# Altium schematic sheet DC116A_MSP430.SchDoc: Controller
size 431 x 279 mm; Date: Not shown in title block; ApprovedBy: Not shown in title block; CheckedBy: Not shown in title block; Author: Not shown in title block; CompanyName: Not shown in title block; DrawnBy: Midhun Raveendran; Engineer: Midhun Raveendran; Organization: Not shown in title block; Address1: Not shown in title block; Address2: Not shown in title block; Address3: Not shown in title block; Address4: Not shown in title block; DocumentNumber: 5; Revision: Use project parameter SCH_Rev; SheetNumber: 5; SheetTotal: 8; PageSetup: Record=PageOptions|CenterHorizontal=True|CenterVertical=True|PrintScale=1.00|XCorrection=1.00|YCorrection=1.00|PrintKind=0|BorderSize=5000000|LeftOffset=0|BottomOffset=0|Orientation=2|PaperLength=1000|PaperWidth=1000|Scale=100|PaperSource=15|PrintQuality=600|MediaType=1|DitherType=10|PaperKind=Letter|PrintScaleMode=1; CurrentTime: Not shown in title block; CurrentDate: Not shown in title block; Time: Not shown in title block; DocumentFullPathAndName: Not shown in title block; DocumentName: Not shown in title block; ModifiedDate: Not shown in title block; ImagePath: Not shown in title block; ProjectName: DC057A
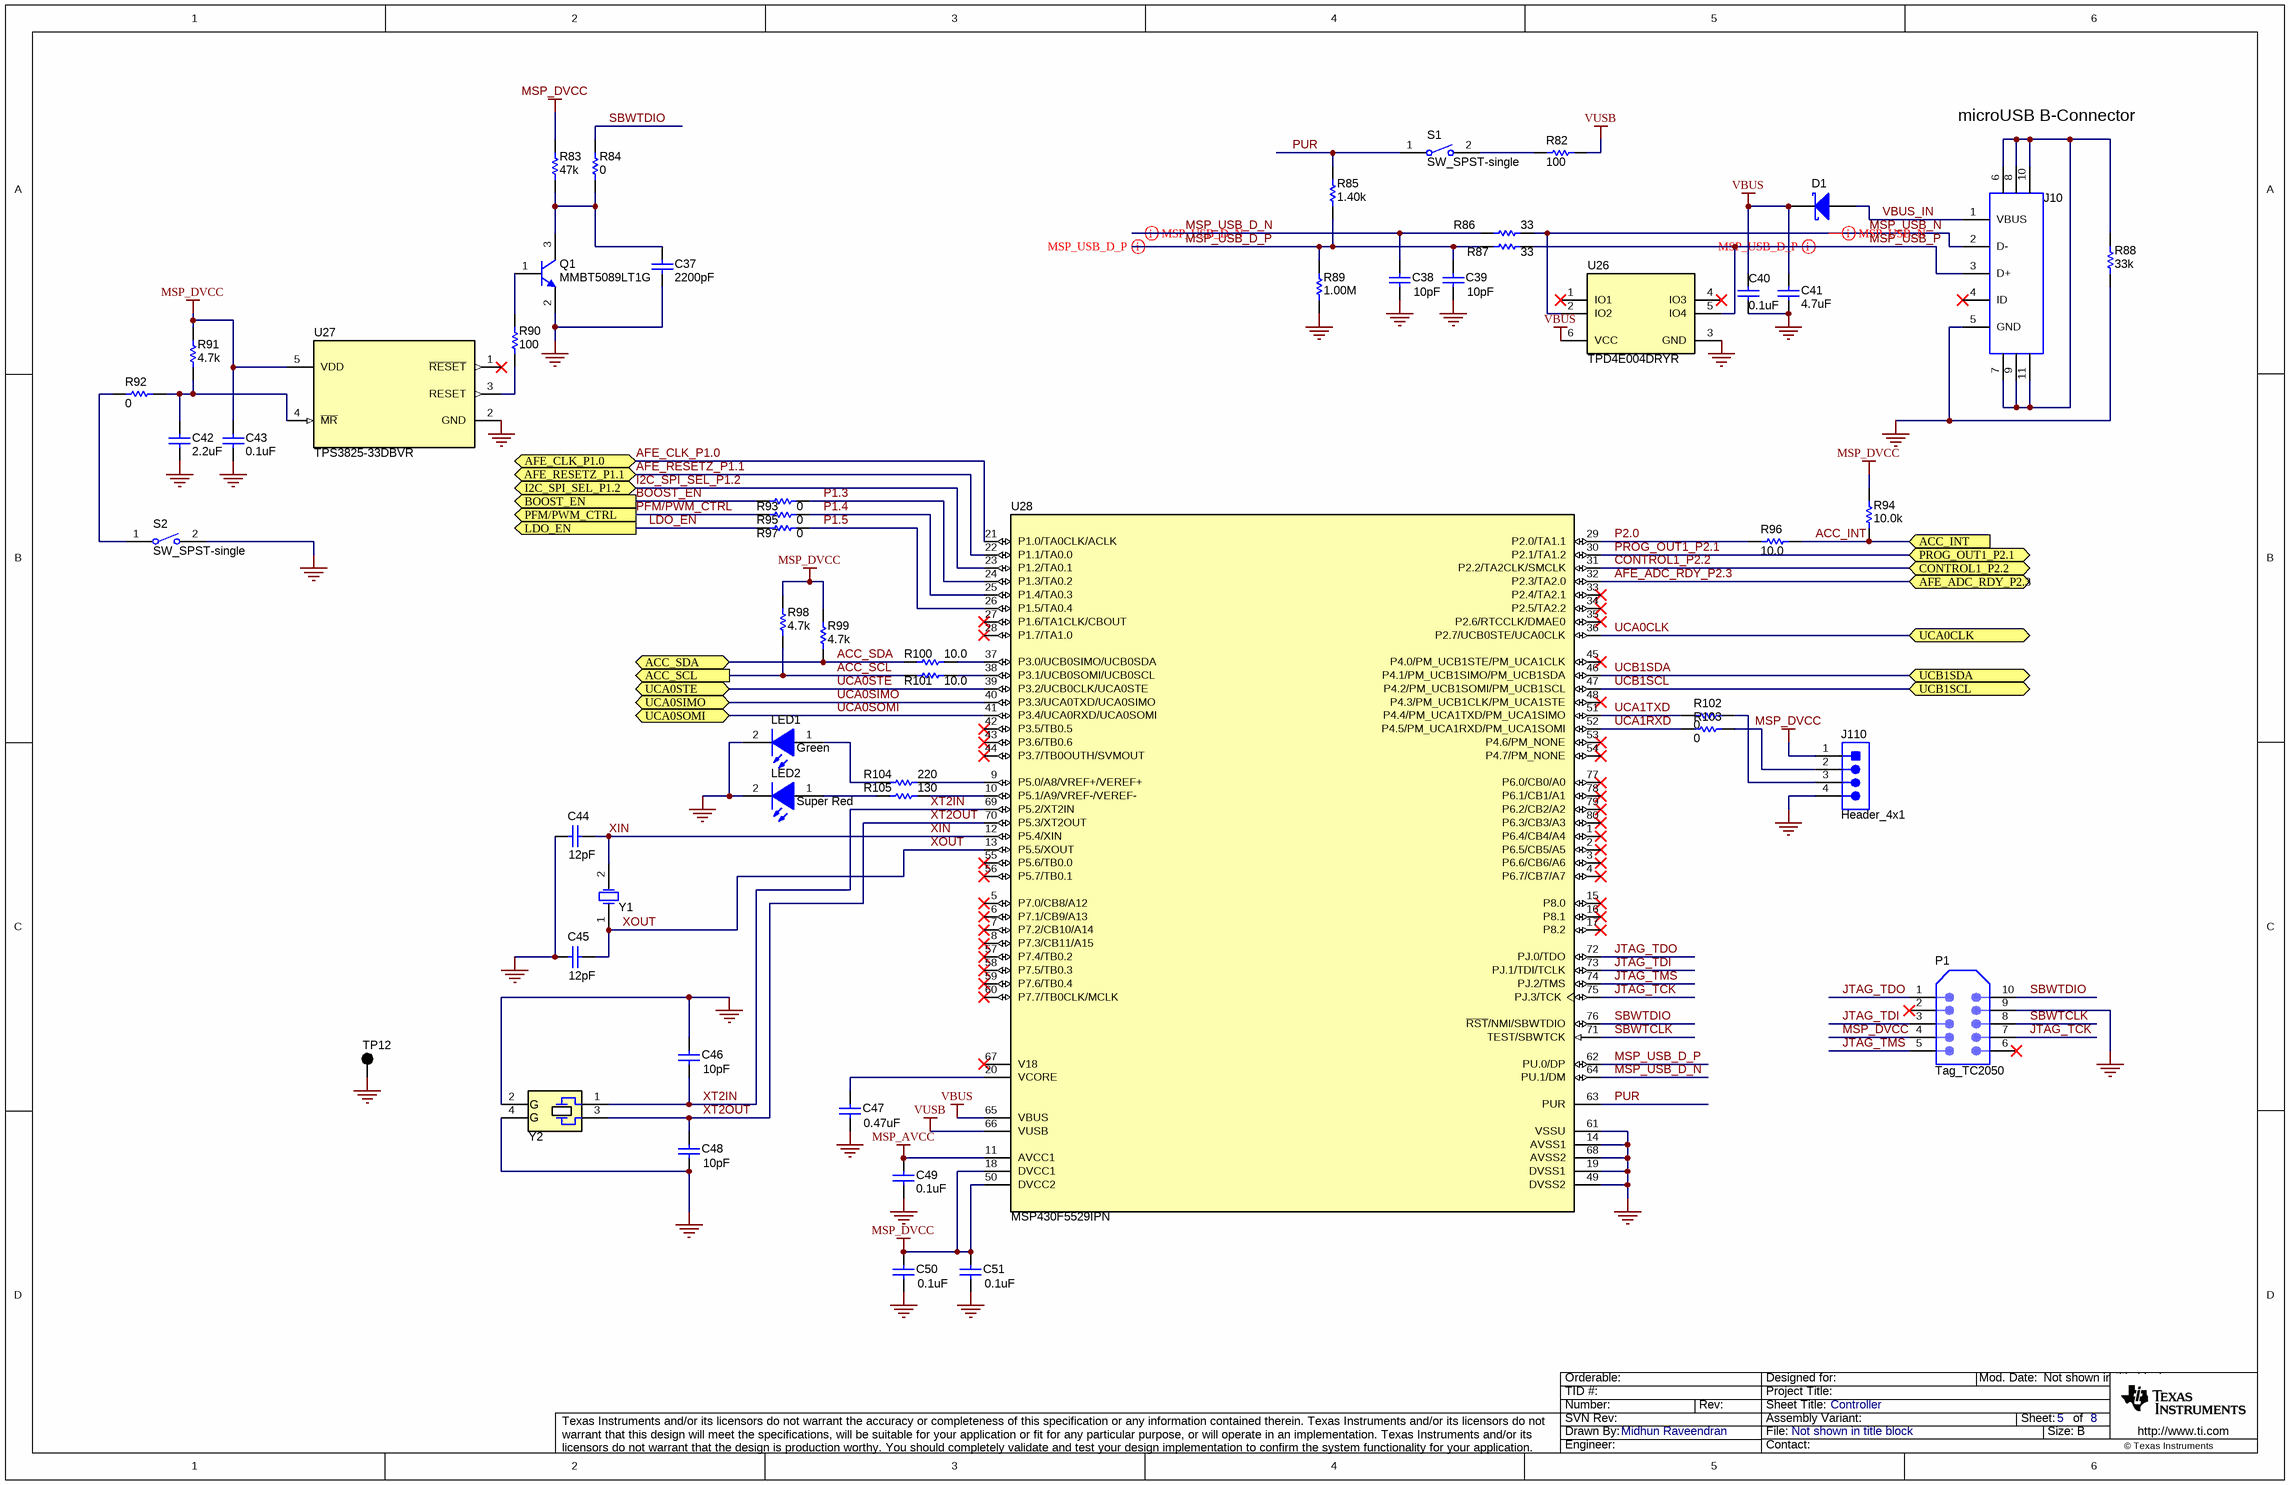
[diagram p0: DC116A_MSP430.SchDoc]

## Parts
C37  ValueDisplayed: 2200pF  [0402]  (hidden comment: Capacitor)
C38  ValueDisplayed: 10pF  [0402]  (hidden comment: 500R07S100JV4T)
C39  ValueDisplayed: 10pF  [0402]  (hidden comment: 500R07S100JV4T)
C40  ValueDisplayed: 0.1uF  [0402]  (hidden comment: 0402YC104KAT2A)
C41  ValueDisplayed: 4.7uF  [0402_065]  (hidden comment: Capacitor)
C42  ValueDisplayed: 2.2uF  [0603]  (hidden comment: Capacitor)
C43  ValueDisplayed: 0.1uF  [0402]  (hidden comment: 0402YC104KAT2A)
C44  ValueDisplayed: 12pF  [0402]  (hidden comment: CL05C120JB5NNNC)
C45  ValueDisplayed: 12pF  [0402]  (hidden comment: CL05C120JB5NNNC)
C46  ValueDisplayed: 10pF  [0402]  (hidden comment: 500R07S100JV4T)
C47  ValueDisplayed: 0.47uF  [0402]  (hidden comment: 04026D474KAT2A)
C48  ValueDisplayed: 10pF  [0402]  (hidden comment: 500R07S100JV4T)
C49  ValueDisplayed: 0.1uF  [0402]  (hidden comment: 0402YC104KAT2A)
C50  ValueDisplayed: 0.1uF  [0402]  (hidden comment: 0402YC104KAT2A)
C51  ValueDisplayed: 0.1uF  [0402]  (hidden comment: 0402YC104KAT2A)
D1  DIODE_SCHOTTKY  [SOD-123]  (value not drawn)
J10  CONN_USB_5Pos-6Shld  [FCI_10118193-0001LF]  (value not drawn)
J110  Header_4x1  [TSW-104-07-G-S]
LED1  value Green  [LED_SML-LX0603GW]  (hidden comment: LED)
LED2  value Super Red  [SML-LX0603SRW_SuperRed]  (hidden comment: LED)
P1  Tag_TC2050  [Tag_TC2050]  (no BOM)
Q1  MMBT5089LT1G  [SOT-23]
R82  ValueDisplayed: 100  [0402]  (hidden comment: Resistor)
R83  ValueDisplayed: 47k  [0402]  (hidden comment: Resistor)
R84  ValueDisplayed: 0  [0402]  (hidden comment: Resistor)
R85  ValueDisplayed: 1.40k  [0402]  (hidden comment: Resistor)
R86  ValueDisplayed: 33  [0402]  (hidden comment: Resistor)
R87  ValueDisplayed: 33  [0402]  (hidden comment: Resistor)
R88  ValueDisplayed: 33k  [0402]  (hidden comment: Resistor)
R89  ValueDisplayed: 1.00M  [0402]  (hidden comment: Resistor)
R90  ValueDisplayed: 100  [0402]  (hidden comment: Resistor)
R91  ValueDisplayed: 4.7k  [0402]  (hidden comment: Resistor)
R92  ValueDisplayed: 0  [0402]  (hidden comment: Resistor)
R93  ValueDisplayed: 0  [0402]  (hidden comment: Resistor)
R94  ValueDisplayed: 10.0k  [0402]  (hidden comment: Resistor)
R95  ValueDisplayed: 0  [0402]  (hidden comment: Resistor)
R96  ValueDisplayed: 10.0  [0402]  (hidden comment: Resistor)
R97  ValueDisplayed: 0  [0402]  (hidden comment: Resistor)
R98  ValueDisplayed: 4.7k  [0402]  (hidden comment: Resistor)
R99  ValueDisplayed: 4.7k  [0402]  (hidden comment: Resistor)
R100  ValueDisplayed: 10.0  [0402]  (hidden comment: Resistor)
R101  ValueDisplayed: 10.0  [0402]  (hidden comment: Resistor)
R102  ValueDisplayed: 0  [0402]  (hidden comment: Resistor)
R103  ValueDisplayed: 0  [0402]  (hidden comment: Resistor)
R104  ValueDisplayed: 220  [0402]  (hidden comment: Resistor)
R105  ValueDisplayed: 130  [0402]  (hidden comment: Resistor)
S1  SW_SPST-single  [SW_RS-032G05A3-SM]
S2  SW_SPST-single  [SW_RS-032G05A3-SM]
TP12  5001  [Keystone5001]  (value not drawn)
U26  PartNumber: TPD4E004DRYR  [DRY0006A]  (hidden comment: TI-TPD4E004-SON_DRY-6)
U27  PartNumber: TPS3825-33DBVR  [DBV0005A_N]  (hidden comment: TPS3825)
U28  PartNumber: MSP430F5529IPN  [PN0080A_N]  (hidden comment: TI-MSP430F552X_A-PN80)
Y1  Xtal  [XTAL_ABS07]  (value not drawn)
Y2  XTAL_4P_13_G24  [ABRACON_ABM3B]  (value not drawn)

## Ports
ACC_INT (in), ACC_SCL (out), ACC_SDA (bidir), AFE_ADC_RDY_P2.3 (bidir), AFE_CLK_P1.0 (bidir), AFE_RESETZ_P1.1 (bidir), BOOST_EN (out), CONTROL1_P2.2 (bidir), I2C_SPI_SEL_P1.2 (bidir), LDO_EN (out), PFM/PWM_CTRL (out), PROG_OUT1_P2.1 (bidir), UCA0CLK (bidir), UCA0SIMO (bidir), UCA0SOMI (bidir), UCA0STE (bidir), UCB1SCL (bidir), UCB1SDA (bidir)

## Nets
GND: C37.2 C38.2 C39.2 C40.1 C41.2 C42.2 C43.1 C44.2 C45.2 C46.1 C47.2 C48.2 C49.1 C50.1 C51.1 J10.5(GND) J110.4 LED1.2(K) LED2.2(K) P1.9 Q1.2(E) R88.1 R89.2 S2.2 TP12.1 U26.3(GND) U27.2(GND) U28.14(AVSS1) U28.19(DVSS1) U28.49(DVSS2) U28.61(VSSU) U28.68(AVSS2) Y2.2(GND) Y2.4(GND)
MSP_AVCC: C49.2 U28.11(AVCC1)
MSP_DVCC: C43.2 C50.2 C51.2 J110.1 P1.4 R83.2 R91.2 R94.2 R98.2 R99.2 U27.5(VDD) U28.18(DVCC1) U28.50(DVCC2)
VBUS: C40.2 C41.1 D1.1(K) U26.6(VCC) U28.65(VBUS)
VUSB: R82.1 U28.66(VUSB)
ACC_INT: R94.1 R96.1 ; port ACC_INT
ACC_SCL: R98.1 R101.2 ; port ACC_SCL
ACC_SDA: R99.1 R100.2 ; port ACC_SDA
AFE_ADC_RDY_P2.3: U28.32(P2.3/TA2.0) ; port AFE_ADC_RDY_P2.3
AFE_CLK_P1.0: U28.21(P1.0/TA0CLK/ACLK) ; port AFE_CLK_P1.0
AFE_RESETZ_P1.1: U28.22(P1.1/TA0.0) ; port AFE_RESETZ_P1.1
BOOST_EN: R93.1 ; port BOOST_EN
CONTROL1_P2.2: U28.31(P2.2/TA2CLK/SMCLK) ; port CONTROL1_P2.2
I2C_SPI_SEL_P1.2: U28.23(P1.2/TA0.1) ; port I2C_SPI_SEL_P1.2
JTAG_TCK: P1.7 U28.75(PJ.3/TCK)
JTAG_TDI: P1.3 U28.73(PJ.1/TDI/TCLK)
JTAG_TDO: P1.1 U28.72(PJ.0/TDO)
JTAG_TMS: P1.5 U28.74(PJ.2/TMS)
LDO_EN: R97.1 ; port LDO_EN
MSP_USB_D_N: C38.1 R86.1 U28.64(PU.1/DM)
MSP_USB_D_P: C39.1 R85.1 R87.1 R89.1 U28.62(PU.0/DP)
MSP_USB_N: J10.2(D-) R86.2 U26.2(IO2)
MSP_USB_P: J10.3(D+) R87.2 U26.5(IO4)
P1.3: R93.2 U28.24(P1.3/TA0.2)
P1.4: R95.2 U28.25(P1.4/TA0.3)
P1.5: R97.2 U28.26(P1.5/TA0.4)
P2.0: R96.2 U28.29(P2.0/TA1.1)
PFM/PWM_CTRL: R95.1 ; port PFM/PWM_CTRL
PROG_OUT1_P2.1: U28.30(P2.1/TA1.2) ; port PROG_OUT1_P2.1
PUR: R85.2 S1.1 U28.63(PUR)
SBWTCLK: P1.8 U28.71(TEST/SBWTCK)
SBWTDIO: P1.10 R84.2 U28.76(~{RST}/NMI/SBWTDIO)
UCA0CLK: U28.36(P2.7/UCB0STE/UCA0CLK) ; port UCA0CLK
UCA0SIMO: U28.40(P3.3/UCA0TXD/UCA0SIMO) ; port UCA0SIMO
UCA0SOMI: U28.41(P3.4/UCA0RXD/UCA0SOMI) ; port UCA0SOMI
UCA0STE: U28.39(P3.2/UCB0CLK/UCA0STE) ; port UCA0STE
UCA1RXD: R103.1 U28.52(P4.5/PM_UCA1RXD/PM_UCA1SOMI)
UCA1TXD: R102.1 U28.51(P4.4/PM_UCA1TXD/PM_UCA1SIMO)
UCB1SCL: U28.47(P4.2/PM_UCB1SOMI/PM_UCB1SCL) ; port UCB1SCL
UCB1SDA: U28.46(P4.1/PM_UCB1SIMO/PM_UCB1SDA) ; port UCB1SDA
VBUS_IN: D1.2(A) J10.1(VBUS)
XIN: C44.1 U28.12(P5.4/XIN) Y1.2(OSC2)
XOUT: C45.1 U28.13(P5.5/XOUT) Y1.1(OSC1)
XT2IN: C46.2 U28.69(P5.2/XT2IN) Y2.1
XT2OUT: C48.1 U28.70(P5.3/XT2OUT) Y2.3
NetC37_1: C37.1 Q1.3(C) R83.1 R84.1
NetC42_1: C42.1 R91.1 R92.2 U27.4(~{MR})
NetC47_1: C47.1 U28.20(VCORE)
NetJ10_6: J10.6 J10.7 J10.8 J10.9 J10.10 J10.11 R88.2
NetJ110_2: J110.2 R103.2
NetJ110_3: J110.3 R102.2
NetLED1_1: LED1.1(A) R104.1
NetLED2_1: LED2.1(A) R105.1
NetQ1_1: Q1.1(B) R90.2
NetR82_2: R82.2 S1.2
NetR90_1: R90.1 U27.3(RESET)
NetR92_1: R92.1 S2.1
NetR100_1: R100.1 U28.37(P3.0/UCB0SIMO/UCB0SDA)
NetR101_1: R101.1 U28.38(P3.1/UCB0SOMI/UCB0SCL)
NetR104_2: R104.2 U28.9(P5.0/A8/VREF+/VEREF+)
NetR105_2: R105.2 U28.10(P5.1/A9/VREF-/VEREF-)

Not connected (* = marked no-connect by the designer): J10 4(ID)*; P1 2* 6*; U26 1(IO1)* 4(IO3)*; U27 1(~{RESET})*; U28 1(P6.4/CB4/A4)* 2(P6.5/CB5/A5)* 3(P6.6/CB6/A6)* 4(P6.7/CB7/A7)* 5(P7.0/CB8/A12)* 6(P7.1/CB9/A13)* 7(P7.2/CB10/A14)* 8(P7.3/CB11/A15)* 15(P8.0)* 16(P8.1)* 17(P8.2)* 27(P1.6/TA1CLK/CBOUT)* 28(P1.7/TA1.0)* 33(P2.4/TA2.1)* 34(P2.5/TA2.2)* 35(P2.6/RTCCLK/DMAE0)* 42(P3.5/TB0.5)* 43(P3.6/TB0.6)* 44(P3.7/TB0OUTH/SVMOUT)* 45(P4.0/PM_UCB1STE/PM_UCA1CLK)* 48(P4.3/PM_UCB1CLK/PM_UCA1STE)* 53(P4.6/PM_NONE)* 54(P4.7/PM_NONE)* 55(P5.6/TB0.0)* 56(P5.7/TB0.1)* 57(P7.4/TB0.2)* 58(P7.5/TB0.3)* 59(P7.6/TB0.4)* 60(P7.7/TB0CLK/MCLK)* 67(V18)* 77(P6.0/CB0/A0)* 78(P6.1/CB1/A1)* 79(P6.2/CB2/A2)* 80(P6.3/CB3/A3)*

## Layout directives
differential pair: MSP_USB_D_N, MSP_USB_D_P, MSP_USB_N, MSP_USB_P

## Notes on the sheet
- microUSB B-Connector
- Drawn By:
- SVN Rev:
- Number:
- TID #:
- Orderable:
- Rev:
- Sheet Title:
- File:
- Project Title:
- Designed for:
- Assembly Variant:
- Mod. Date:
- Sheet:
- Size:
- of
- B
- http://www.ti.com
- Texas Instruments and/or its licensors do not warrant the accuracy or completeness of this specification or any information contained therein. Texas Instruments and/or its licensors do not warrant that this design will meet the specifications, will be suitable for your application or fit for any particular purpose, or will operate in an implementation. Texas Instruments and/or its licensors do not warrant that the design is production worthy. You should completely validate and test your design implementation to confirm the system functionality for your application.
- Engineer:
- Contact:
- © Texas Instruments
- (in symbol CMP-0004629-4) G

## Library data of the parts
C37 = CMP-0006683-2: CAP, CERM, 2200 pF, 50 V, +/- 10%, X7R, 0402; PartNumber: GRM155R71H222KA01D; Manufacturer: MuRata; Polarized: N; Value: 2200pF; U/M: EA; Cap_F: 2.2nF; Value1: Unknown; VDC_V: 50V; TaMin_C: -55°C; TaMax_C: 125°C; SizeArea_mm2: 0.5; SizeAreaWB_mm2: 3; SizeX_mm: 1; SizeZ_mm: 0.6; AEC Category: Q200; CompType: Capacitor; PackageReference: 0402; RoHS: Y; Tolerance_%: 10%; Value2: 50V; MountType: SMT; Technology: Ceramic; TempCo: X7R; Cap_Case: 0402; Published: 2008-06-19; Publisher: Texas Instruments; LatestRevisionDate: 2017-03-09; ComponentLink1Description: Datasheet link; ComponentLink1URL: http://search.murata.co.jp/Ceramy/PnsearchViewAction.do?HnOFG=ON&HnNFG=ON&SEL_CNT=50&sLang=en&sKey=GRM155R71H222KA01D&x=9&y=9&search=startwith; Supplier 1: Digi-Key; Supplier Part Number 1: 490-1305-1-ND; Supplier 2: Newark; Supplier Part Number 2: 14T3287; Supplier 3: Mouser; Supplier Part Number 3: 81-GRM36X222K50; SizeY_mm: 0.5; AEC Qualified: ?
C38 C39 C46 C48 = CMP-0006207-2: CAP, CERM, 10 pF, 50 V, +/- 5%, C0G/NP0, 0402; Manufacturer: Johanson Technology; TaMin_C: -55°C; Polarized: N; SizeAreaWB_mm2: 3; Value1: Unknown; U/M: EA; Value: 10pF; TaMax_C: 125°C; SizeZ_mm: 0.6; SizeX_mm: 1; SizeY_mm: 0.5; Value2: 50V; AEC Category: Q200; Publisher: Texas Instruments; TempCo: C0G/NP0; Published: 2008-06-19; RoHS: Y; MountType: SMT; PackageReference: 0402; Tolerance_%: 5%; Cap_Case: 0402; SizeArea_mm2: 0.5; CompType: Capacitor; LatestRevisionDate: 2017-03-09; PartNumber: 500R07S100JV4T; AEC Qualified: ?; Cap_F: 10pF; VDC_V: 50V; ComponentLink1Description: Datasheet link; Technology: Ceramic; ComponentLink1URL: http://www.johansontechnology.com/images/stories/catalog/JTI_CAT_2012_MLCC_HighQ.pdf
C40 C43 C49-C51 = CMP-0006201-2: CAP, CERM, 0.1 uF, 16 V, +/- 10%, X7R, 0402; Manufacturer: AVX; TaMin_C: -55°C; Polarized: N; SizeAreaWB_mm2: 3; Value1: Unknown; U/M: EA; Value: 0.1uF; TaMax_C: 125°C; SizeZ_mm: 0.6; SizeX_mm: 1; SizeY_mm: 0.5; Value2: 16V; Cap_F: 100nF; AEC Category: Q200; Supplier Part Number 2: 09R7024; Publisher: Texas Instruments; Supplier 2: Newark; Supplier Part Number 3: 581-0402YC104KAT2A; TempCo: X7R; Supplier 3: Mouser; Published: 2008-06-19; RoHS: Y; MountType: SMT; Supplier 1: Digi-Key; PackageReference: 0402; Tolerance_%: 10%; Cap_Case: 0402; SizeArea_mm2: 0.5; CompType: Capacitor; LatestRevisionDate: 2017-03-09; PartNumber: 0402YC104KAT2A; AEC Qualified: N; VDC_V: 16V; ComponentLink1Description: Datasheet link; AEC Grade: N/A; Supplier Part Number 1: 478-7888-1-ND; Technology: Ceramic; ComponentLink1URL: http://catalogs.avx.com/SurfaceMount.pdf
C41 = CMP-0006268-2: CAP, CERM, 4.7 uF, 10 V, +/- 10%, X5R, 0402; PartNumber: C1005X5R1A475K050BC; Manufacturer: TDK; Polarized: N; Value: 4.7uF; U/M: EA; Cap_F: 4.7µF; ESR_ohm: 3.417m; Value1: 0.003417 ohm; VDC_V: 10V; IRMS_A: 2.7063A; TaMin_C: -55°C; TaMax_C: 85°C; SizeArea_mm2: 0.5; SizeAreaWB_mm2: 3; SizeX_mm: 1; SizeZ_mm: 0.65; AEC Category: Q200; CompType: Capacitor; PackageReference: 0402; RoHS: Y; Tolerance_%: 10%; Value2: 10V; MountType: SMT; Technology: Ceramic; TempCo: X5R; Cap_Case: 0402_065; Published: 2008-06-19; Publisher: Texas Instruments; LatestRevisionDate: 2017-03-09; ComponentLink1Description: Datasheet link; ComponentLink1URL: https://product.tdk.com/en/search/capacitor/ceramic/mlcc/info?part_no=C1005X5R1A475K050BC; Supplier 1: Digi-Key; Supplier Part Number 1: 445-13820-1-ND; Supplier 2: Newark; Supplier Part Number 2: 29X4772; Supplier 3: Mouser; Supplier Part Number 3: 810-C1005X5R1A475KBC; SizeY_mm: 0.5; AEC Qualified: N; AEC Grade: N/A
C42 = CMP-0006906-5: CAP, CERM, 2.2 uF, 10 V, +/- 10%, X5R, 0603; PartNumber: C0603C225K8PACTU; Manufacturer: Kemet; Polarized: N; Value: 2.2uF; U/M: EA; Cap_F: 2.2µF; Value1: Unknown; VDC_V: 10V; TaMin_C: -55°C; TaMax_C: 85°C; SizeArea_mm2: 1.28; SizeAreaWB_mm2: 4.68; SizeX_mm: 1.6; SizeY_mm: 0.8; SizeZ_mm: 1; AEC Category: Q200; CompType: Capacitor; PackageReference: 0603; RoHS: Y; Tolerance_%: 10%; Value2: 10V; MountType: SMT; Technology: Ceramic; TempCo: X5R; Cap_Case: 0603; Published: 2008-06-19; Publisher: Texas Instruments; LatestRevisionDate: 2017-03-09; ComponentLink1Description: Datasheet link; ComponentLink1URL: http://www.kemet.com/kemet/web/homepage/kechome.nsf/vapubfiles/F3102_Y5V.pdf/$file/F3102_Y5V.pdf; Supplier 1: Digi-Key; Supplier Part Number 1: 399-4911-1-ND; Supplier 2: Mouser; Supplier Part Number 2: 80-C0603C225K8P; Supplier 3: Farnell; Supplier Part Number 3: 1108322; AEC Qualified: ?
C44 C45 = CMP-0006345-2: CAP, CERM, 12 pF, 50 V, +/- 5%, C0G/NP0, 0402; Manufacturer: Samsung Electro-Mechanics; TaMin_C: -55°C; Polarized: N; SizeAreaWB_mm2: 3; Value1: Unknown; U/M: EA; Value: 12pF; TaMax_C: 125°C; SizeZ_mm: 0.6; SizeX_mm: 1; SizeY_mm: 0.5; Value2: 50V; AEC Category: Q200; Publisher: Texas Instruments; TempCo: C0G/NP0; Published: 2008-06-19; RoHS: Y; MountType: SMT; Supplier 1: Digi-Key; PackageReference: 0402; Tolerance_%: 5%; Cap_Case: 0402; SizeArea_mm2: 0.5; CompType: Capacitor; LatestRevisionDate: 2017-03-09; PartNumber: CL05C120JB5NNNC; AEC Qualified: N; Cap_F: 12pF; VDC_V: 50V; ComponentLink1Description: Datasheet link; AEC Grade: N/A; Supplier Part Number 1: 1276-1178-1-ND; Technology: Ceramic; ComponentLink1URL: http://www.samsungsem.com/servlet/FileDownload?type=spec&file=CL05C120JB5NNNC.pdf
C47 = CMP-0006199-2: CAP, CERM, 0.47 uF, 6.3 V, +/- 10%, X5R, 0402; Manufacturer: AVX; TaMin_C: -55°C; Polarized: N; SizeAreaWB_mm2: 3; Value1: Unknown; U/M: EA; Value: 0.47uF; TaMax_C: 85°C; SizeZ_mm: 0.6; SizeX_mm: 1; SizeY_mm: 0.5; Value2: 6.3V; Cap_F: 470nF; AEC Category: Q200; Supplier Part Number 2: 60R6163; Publisher: Texas Instruments; Supplier 2: Newark; Supplier Part Number 3: 581-04026D474KAT2A; TempCo: X5R; Supplier 3: Mouser; Published: 2008-06-19; RoHS: Y; MountType: SMT; Supplier 1: Digi-Key; PackageReference: 0402; Tolerance_%: 10%; Cap_Case: 0402; SizeArea_mm2: 0.5; CompType: Capacitor; LatestRevisionDate: 2017-03-09; PartNumber: 04026D474KAT2A; AEC Qualified: N; VDC_V: 6.3V; ComponentLink1Description: Datasheet link; AEC Grade: N/A; Supplier Part Number 1: 478-6196-1-ND; Technology: Ceramic; ComponentLink1URL: http://catalogs.avx.com/SurfaceMount.pdf
D1 = CMP-0028543-1: Diode, Schottky, 40 V, 0.35 A, SOD-123; PartNumber: SD103AW-7-F; Manufacturer: Diodes Inc.; U/M: EA; Vf_V: 5.5dV; Value: 40V; Value1: 0.35A; Value2: 0.55V; Io_A: 3.5dA; SizeAreaWB_mm2: 13.095; SizeArea_mm2: 6.545; SizeX_mm: 3.85; SizeY_mm: 1.7; SizeZ_mm: 1.35; AEC Category: Q101; Green_Lifecycle: Active; Green_REACh: Passed; CompType: Diode; PackageReference: SOD-123; Vr_V: 40V; MountType: SMT; Type: Schottky; RoHS: Y; Published: 2008-06-26; Publisher: Texas Instruments; LatestRevisionDate: 2017-05-08; ComponentLink1Description: Datasheet link; ComponentLink1URL: http://www.diodes.com/datasheets/ds11013.pdf; Supplier 1: Digi-Key; Supplier Part Number 1: SD103-AWDICT-ND; Supplier 2: Mouser; Supplier Part Number 2: 621-SD103AW-F; Supplier 3: Farnell; Supplier Part Number 3: 1773500; AEC Qualified: ?; Green_EU RoHS-2: Passed; Green_EU RoHS: Passed
J10 = CMP-0065029-1: Connector, Receptacle, USB Micro B, R/A, SMT; PartNumber: 10118193-0001LF; Manufacturer: FCI; Pitch_mm: 0.65; Gender: Female; Row_Count: 1; ContactFinish: Gold; CNHeader: False; CT: True; PackageReference: Connector, Receptacle, USB Micro B, R/A, SMT; CompType: USB; MountType: SMT; ComponentLink1Description: Datasheet URL; ComponentLink1URL: https://sps06.itg.ti.com/sites/KMS/crossdivteams/altium/docs/ComponentDatasheets/10118193-0001LF.pdf; Orientation: R/A; PinCount: 5; Color: Black; Publisher: Texas Instruments; LatestRevisionDate: 2017-06-05; Supplier 1: Digi-Key; Supplier Part Number 1: 609-4616-1-ND; Supplier 2: Newark; Supplier Part Number 2: 67T2259; Supplier 3: Mouser; Supplier Part Number 3: 649-10118193-0001LF
J110 = CMP-0075409-2: Header, 100mil, 4x1, Gold, TH; Manufacturer: Samtec; Pitch_mm: 2.54; Gender: Male; Shrouded: N; Row_Count: 1; Current_A: 6.3A; Voltage_V: 550V; Cert_CSA: Y; Green_Lifecycle: Active; Green_REACh: Passed; PartNumber: TSW-104-07-G-S; PackageReference: 4x1 Header; ClassName: Header; CompType: Header; RoHS: Y; MountType: TH; ComponentLink1Description: Datasheet URL; ComponentLink1URL: http://samtec.com/ftppub/pdf/TSW_TH.PDF; Supplier 1: Digi-Key; Supplier Part Number 1: SAM1029-04-ND; Orientation: Vertical; PinCount: 4; ContactFinish: Gold; Color: Black; Cert_UL: Y; Cert_CULUS: N; Cert_VDE: N; Green_EU RoHS-2: Passed; Green_EU RoHS: Passed
LED1 = CMP-0002834-1: LED, Green, SMD; Manufacturer: Lumex; PartNumber: SML-LX0603GW-TR; Vf_V: 2.2V; Io_A: 20mA; Tjmax_C: 85°C; Value1: W; U/M: EA; CompType: LED; MountType: SMT; RoHS: Y; PackageReference: LED, GREEN, 0603; Type: ?; Value2: 2.2V; Color: green; Published: 2008-07-11; Publisher: Texas Instruments; ComponentLink1URL: http://www.lumex.com/specs/SML-LX0603GW-TR.pdf; ComponentLink1Description: Datasheet link; LatestRevisionDate: 2017-03-09; Supplier 1: Digi-Key; Supplier Part Number 1: 67-1549-1-ND; Supplier 2: Newark; Supplier Part Number 2: 75K1440; Supplier 3: Mouser; Supplier Part Number 3: 696-SML-LX0603GW
LED2 = CMP-0002876-1: LED, Super Red, SMD; Manufacturer: Lumex; PartNumber: SML-LX0603SRW-TR; Vf_V: 1.7V; Io_A: 20mA; Value1: W; U/M: EA; CompType: LED; MountType: SMT; RoHS: Y; PackageReference: LED, 1.6x.6x.8mm; Type: ?; Value2: 1.7V; Color: super red; Published: 2008-07-11; Publisher: Texas Instruments; ComponentLink1URL: http://www.lumex.com/specs/SML-LX0603SRW-TR.pdf; ComponentLink1Description: Datasheet link; LatestRevisionDate: 2017-03-09; Supplier 1: Digi-Key; Supplier Part Number 1: 67-1551-1-ND; Supplier 2: Newark; Supplier Part Number 2: 09J9551; Supplier 3: Mouser; Supplier Part Number 3: 696-SML-LX0603SRW
P1 = CMP-0075050-1: Footprint for Tag-Connect TC2050 cables; PartNumber: TC2050-IDC-FP; CompType: Receptacle; Note: Footprint only, to mate with Tag-Connect TC2050 cables; CNHeader: False; Manufacturer: Tag-Connect; PackageReference: Footprint for TC2050 series of cables; RoHS: Y; MountType: N/A; ComponentLink1Description: Datasheet URL; ComponentLink1URL: http://www.tag-connect.com/Materials/TC2050-IDC%20Datasheet.pdf; Publisher: Texas Instruments; LatestRevisionDate: 2017-07-12; CT: False
Q1 = CMP-0000465-2: Transistor, NPN, 25 V, 0.05 A, SOT-23; Manufacturer: ON Semiconductor; CompType: BJT; PNP: 0; NPN: 1; Vceo_V: 25V; Vcesat1_V: 5dV; Value: 25 V; IcRated_A: 50mA; Value1: 0.05 A; HfeMax: 1200; TaMin_C: -55°C; TaMax_C: 150°C; U/M: EA; SizeAreaWB_mm2: 14; SizeArea_mm2: 7.5; SizeX_mm: 2.5; SizeY_mm: 3; SizeZ_mm: 1.1; AEC Category: Q101; PartNumber: MMBT5089LT1G; PackageReference: SOT-23; RoHS: Y; Value2: 1200; Published: 2008-07-31; LatestRevisionDate: 2017-03-09; Publisher: Texas Instruments; ComponentLink1Description: Datasheet link; ComponentLink1URL: http://www.onsemi.com/pub_link/Collateral/MMBT5088LT1-D.PDF; Supplier 1: Digi-Key; Supplier Part Number 1: MMBT5089LT1GOSCT-ND; Supplier 2: Newark; Supplier Part Number 2: 98H0755; Supplier 3: Mouser; Supplier Part Number 3: 863-MMBT5089LT1G; MountType: SMT; AEC Qualified: ?
R82 R90 = CMP-0025951-3: RES, 100, 1%, 0.063 W, AEC-Q200 Grade 0, 0402; PartNumber: CRCW0402100RFKED; Manufacturer: Vishay-Dale; Value: 100; Value_Code: 100R; Power_W: 63mW; Value2: 0.063W; VDC_V: 50V; TempCo: 100 ppm/C; EIA_Code: E96; SizeArea_mm2: 0.5; SizeX_mm: 1; SizeZ_mm: 0.6; AEC Category: Q200; AEC Qualified: Y; AEC Grade: 0; CompType: Resistor; PackageReference: 0402; RoHS: E; Res_ohm: 100; Tolerance_%: 1%; Value1: 1%; MountType: SMT; Technology: Thick Film; ComponentLink1Description: Datasheet link; ComponentLink1URL: http://www.vishay.com/docs/20035/dcrcwe3.pdf; Supplier 1: Digi-Key; Supplier Part Number 1: 541-100LCT-ND; Supplier 2: Newark; Supplier Part Number 2: 52K6609; Supplier 3: Mouser; Supplier Part Number 3: 71-CRCW0402-100-E3; SizeY_mm: 0.5
R83 = CMP-0026935-3: RES, 47 k, 5%, 0.063 W, AEC-Q200 Grade 0, 0402; PartNumber: CRCW040247K0JNED; Manufacturer: Vishay-Dale; Value: 47k; Value_Code: 47k0; Power_W: 63mW; Value2: 0.063W; VDC_V: 50V; TempCo: 200 ppm/C; EIA_Code: E24; SizeArea_mm2: 0.5; SizeX_mm: 1; SizeZ_mm: 0.6; AEC Category: Q200; AEC Qualified: Y; AEC Grade: 0; CompType: Resistor; PackageReference: 0402; RoHS: E; Res_ohm: 47k; Tolerance_%: 5%; Value1: 5%; MountType: SMT; Technology: Thick Film; ComponentLink1Description: Datasheet link; ComponentLink1URL: http://www.vishay.com/docs/20035/dcrcwe3.pdf; Supplier 1: Digi-Key; Supplier Part Number 1: 541-47KJCT-ND; Supplier 2: Newark; Supplier Part Number 2: 52K7099; Supplier 3: Mouser; Supplier Part Number 3: 71-CRCW0402-J-47K-E3; SizeY_mm: 0.5
R84 R92 R93 R95 R97 R102 R103 = CMP-0026822-3: RES, 0, 5%, 0.063 W, AEC-Q200 Grade 0, 0402; PartNumber: CRCW04020000Z0ED; Manufacturer: Vishay-Dale; Value: 0; Value_Code: 0000; Power_W: 63mW; Value2: 0.063W; VDC_V: 50V; TempCo: 200 ppm/C; EIA_Code: E24; SizeArea_mm2: 0.5; SizeX_mm: 1; SizeZ_mm: 0.6; AEC Category: Q200; AEC Qualified: Y; CompType: Resistor; PackageReference: 0402; RoHS: E; Res_ohm: 0; Tolerance_%: 5%; Value1: 5%; MountType: SMT; Technology: Thick Film; ComponentLink1Description: Datasheet link; ComponentLink1URL: http://www.vishay.com/docs/20035/dcrcwe3.pdf; Supplier 1: Digi-Key; Supplier Part Number 1: 541-0.0JCT-ND; Supplier 2: Newark; Supplier Part Number 2: 52K6543; Supplier 3: Mouser; Supplier Part Number 3: 71-CRCW0402-0-E3; SizeY_mm: 0.5; AEC Grade: 0
R85 = CMP-0026085-3: RES, 1.40 k, 1%, 0.063 W, AEC-Q200 Grade 0, 0402; PartNumber: CRCW04021K40FKED; Manufacturer: Vishay-Dale; Value: 1.40k; Res_ohm: 1.4k; Value_Code: 1k40; Power_W: 63mW; Value2: 0.063W; VDC_V: 50V; TempCo: 100 ppm/C; EIA_Code: E96; SizeArea_mm2: 0.5; SizeX_mm: 1; SizeZ_mm: 0.6; AEC Category: Q200; AEC Qualified: Y; AEC Grade: 0; CompType: Resistor; PackageReference: 0402; RoHS: E; Tolerance_%: 1%; Value1: 1%; MountType: SMT; Technology: Thick Film; ComponentLink1Description: Datasheet link; ComponentLink1URL: http://www.vishay.com/docs/20035/dcrcwe3.pdf; Supplier 1: Digi-Key; Supplier Part Number 1: 541-1.40KLCT-ND; Supplier 2: Newark; Supplier Part Number 2: 52K6569; Supplier 3: Mouser; Supplier Part Number 3: 71-CRCW0402-1.4K-E3; SizeY_mm: 0.5
R86 R87 = CMP-0026908-3: RES, 33, 5%, 0.063 W, AEC-Q200 Grade 0, 0402; PartNumber: CRCW040233R0JNED; Manufacturer: Vishay-Dale; Value: 33; Value_Code: 33R0; Power_W: 63mW; Value2: 0.063W; VDC_V: 50V; TempCo: 200 ppm/C; EIA_Code: E24; SizeArea_mm2: 0.5; SizeX_mm: 1; SizeZ_mm: 0.6; AEC Category: Q200; AEC Qualified: Y; AEC Grade: 0; CompType: Resistor; PackageReference: 0402; RoHS: E; Res_ohm: 33; Tolerance_%: 5%; Value1: 5%; MountType: SMT; Technology: Thick Film; ComponentLink1Description: Datasheet link; ComponentLink1URL: http://www.vishay.com/docs/20035/dcrcwe3.pdf; Supplier 1: Digi-Key; Supplier Part Number 1: 541-33JCT-ND; Supplier 2: Newark; Supplier Part Number 2: 72M6782; Supplier 3: Mouser; Supplier Part Number 3: 71-CRCW0402J-33-E3; SizeY_mm: 0.5
R88 = CMP-0026907-3: RES, 33 k, 5%, 0.063 W, AEC-Q200 Grade 0, 0402; PartNumber: CRCW040233K0JNED; Manufacturer: Vishay-Dale; Value: 33k; Value_Code: 33k0; Power_W: 63mW; Value2: 0.063W; VDC_V: 50V; TempCo: 200 ppm/C; SizeArea_mm2: 0.5; SizeX_mm: 1; SizeZ_mm: 0.6; EIA_Code: E24; AEC Category: Q200; AEC Qualified: Y; AEC Grade: 0; CompType: Resistor; PackageReference: 0402; RoHS: E; Res_ohm: 33k; Tolerance_%: 5%; Value1: 5%; MountType: SMT; Technology: Thick Film; SizeY_mm: 0.5; ComponentLink1Description: Datasheet link; ComponentLink1URL: http://www.vishay.com/docs/20035/dcrcwe3.pdf; Supplier 1: Digi-Key; Supplier Part Number 1: 541-33KJCT-ND; Supplier 2: Newark; Supplier Part Number 2: 59M6727; Supplier 3: Mouser; Supplier Part Number 3: 71-CRCW0402J-33K-E3
R89 = CMP-0026100-2: RES, 1.00 M, 1%, 0.063 W, AEC-Q200 Grade 0, 0402; PartNumber: CRCW04021M00FKED; Manufacturer: Vishay-Dale; Value: 1.00Meg; Res_ohm: 1M; Value_Code: 1M00; Power_W: 63mW; Value2: 0.063W; VDC_V: 50V; TempCo: 100 ppm/C; EIA_Code: E96; SizeArea_mm2: 0.5; SizeX_mm: 1; SizeZ_mm: 0.6; AEC Category: Q200; AEC Qualified: Y; AEC Grade: 0; CompType: Resistor; PackageReference: 0402; RoHS: E; Tolerance_%: 1%; Value1: 1%; MountType: SMT; Technology: Thick Film; ComponentLink1Description: Datasheet link; ComponentLink1URL: http://www.vishay.com/docs/20035/dcrcwe3.pdf; Supplier 1: Digi-Key; Supplier Part Number 1: 541-1.00MLCT-ND; Supplier 2: Newark; Supplier Part Number 2: 52K6593; Supplier 3: Mouser; Supplier Part Number 3: 71-CRCW0402-1.0M-E3; SizeY_mm: 0.5
R91 R98 R99 = CMP-0026938-5: RES, 4.7 k, 5%, 0.063 W, AEC-Q200 Grade 0, 0402; PartNumber: CRCW04024K70JNED; Manufacturer: Vishay-Dale; Value: 4.7k; Value_Code: 4k70; Power_W: 63mW; Value2: 0.063W; VDC_V: 50V; TempCo: 200 ppm/C; EIA_Code: E24; SizeArea_mm2: 0.5; SizeX_mm: 1; SizeZ_mm: 0.6; AEC Category: Q200; AEC Qualified: Y; AEC Grade: 0; CompType: Resistor; PackageReference: 0402; RoHS: E; Res_ohm: 4.7k; Tolerance_%: 5%; Value1: 5%; MountType: SMT; Technology: Thick Film; ComponentLink1Description: Datasheet link; ComponentLink1URL: http://www.vishay.com/docs/20035/dcrcwe3.pdf; Supplier 1: Digi-Key; Supplier Part Number 1: 541-4.7KJCT-ND; Supplier 2: Newark; Supplier Part Number 2: 59M6733; Supplier 3: Mouser; Supplier Part Number 3: 71-CRCW0402J-4.7K-E3; SizeY_mm: 0.5
R94 = CMP-0025958-3: RES, 10.0 k, 1%, 0.063 W, AEC-Q200 Grade 0, 0402; PartNumber: CRCW040210K0FKED; Manufacturer: Vishay-Dale; Value: 10.0k; Res_ohm: 10k; Value_Code: 10k0; Power_W: 63mW; Value2: 0.063W; VDC_V: 50V; TempCo: 100 ppm/C; EIA_Code: E96; SizeArea_mm2: 0.5; SizeX_mm: 1; SizeZ_mm: 0.6; AEC Category: Q200; AEC Qualified: Y; AEC Grade: 0; CompType: Resistor; PackageReference: 0402; RoHS: E; Tolerance_%: 1%; Value1: 1%; MountType: SMT; Technology: Thick Film; ComponentLink1Description: Datasheet link; ComponentLink1URL: http://www.vishay.com/docs/20035/dcrcwe3.pdf; Supplier 1: Digi-Key; Supplier Part Number 1: 541-10.0KLCT-ND; Supplier 2: Newark; Supplier Part Number 2: 52K6595; Supplier 3: Mouser; Supplier Part Number 3: 71-CRCW0402-10K-E3; SizeY_mm: 0.5
R96 R100 R101 = CMP-0025963-3: RES, 10.0, 1%, 0.063 W, AEC-Q200 Grade 0, 0402; PartNumber: CRCW040210R0FKED; Manufacturer: Vishay-Dale; Value: 10.0; Res_ohm: 10; Value_Code: 10R0; Power_W: 63mW; Value2: 0.063W; VDC_V: 50V; TempCo: 100 ppm/C; EIA_Code: E96; SizeArea_mm2: 0.5; SizeX_mm: 1; SizeZ_mm: 0.6; AEC Category: Q200; AEC Qualified: Y; AEC Grade: 0; CompType: Resistor; PackageReference: 0402; RoHS: E; Tolerance_%: 1%; Value1: 1%; MountType: SMT; Technology: Thick Film; ComponentLink1Description: Datasheet link; ComponentLink1URL: http://www.vishay.com/docs/20035/dcrcwe3.pdf; Supplier 1: Digi-Key; Supplier Part Number 1: 541-10.0LCT-ND; Supplier 2: Newark; Supplier Part Number 2: 52K6600; Supplier 3: Mouser; Supplier Part Number 3: 71-CRCW0402-10-E3; SizeY_mm: 0.5
R104 = CMP-0026878-3: RES, 220, 5%, 0.063 W, AEC-Q200 Grade 0, 0402; PartNumber: CRCW0402220RJNED; Manufacturer: Vishay-Dale; Value: 220; Value_Code: 220R; Power_W: 63mW; Value2: 0.063W; VDC_V: 50V; TempCo: 200 ppm/C; EIA_Code: E24; SizeArea_mm2: 0.5; SizeX_mm: 1; SizeZ_mm: 0.6; AEC Category: Q200; AEC Qualified: Y; AEC Grade: 0; CompType: Resistor; PackageReference: 0402; RoHS: E; Res_ohm: 220; Tolerance_%: 5%; Value1: 5%; MountType: SMT; Technology: Thick Film; ComponentLink1Description: Datasheet link; ComponentLink1URL: http://www.vishay.com/docs/20035/dcrcwe3.pdf; Supplier 1: Digi-Key; Supplier Part Number 1: 541-220JCT-ND; Supplier 2: Newark; Supplier Part Number 2: 59M6718; Supplier 3: Mouser; Supplier Part Number 3: 71-CRCW0402J-220-E3; SizeY_mm: 0.5
R105 = CMP-0026837-3: RES, 130, 5%, 0.063 W, AEC-Q200 Grade 0, 0402; PartNumber: CRCW0402130RJNED; Manufacturer: Vishay-Dale; Value: 130; Value_Code: 130R; Power_W: 63mW; Value2: 0.063W; VDC_V: 50V; TempCo: 200 ppm/C; EIA_Code: E24; SizeArea_mm2: 0.5; SizeX_mm: 1; SizeZ_mm: 0.6; AEC Category: Q200; AEC Qualified: Y; AEC Grade: 0; CompType: Resistor; PackageReference: 0402; RoHS: E; Res_ohm: 130; Tolerance_%: 5%; Value1: 5%; MountType: SMT; Technology: Thick Film; ComponentLink1Description: Datasheet link; ComponentLink1URL: http://www.vishay.com/docs/20035/dcrcwe3.pdf; Supplier 1: Digi-Key; Supplier Part Number 1: 541-130JCT-ND; Supplier 2: Newark; Supplier Part Number 2: 89M6605; Supplier 3: Mouser; Supplier Part Number 3: 71-CRCW0402130RJNED; SizeY_mm: 0.5
S1 S2 = CMP-0002210-1: Switch, Tactile, SPST-NO, 0.05A, 12V, SMD; PartNumber: RS-032G05A3-SM RT; Manufacturer: C&K Components; SwitchFunction: Off-Mom; PositionCount: 1; CurrentRating_mA: 50A; MountType: SMT; ComponentLink1Description: Datasheet URL; ComponentLink1URL: http://www.ck-components.com/83942/rs_18dec13.pdf/; RoHS: Y; Circuit: SPST-NO; VDC_V: 12V; Orientation: Top Actuated; CompType: Switch; PackageReference: SPST, 6x3.5mm; Publisher: Texas Instruments; LatestRevisionDate: 2017-03-09; Supplier 1: Digi-Key; Supplier Part Number 1: CKN10388CT-ND; Supplier 2: Mouser; Supplier Part Number 2: 611-RS-032G05A3-SMRT
TP12 = CMP-0055138-1: Test Point, Miniature, Black, TH; Manufacturer: Keystone; ContactFinish: Silver; CNHeader: FALSE; CT: TRUE; Green_Lifecycle: Active; Green_REACh: Passed; PartNumber: 5001; PackageReference: Black Miniature Testpoint; CompType: Test Point; RoHS: Y; MountType: TH; ComponentLink1Description: Datasheet URL; ComponentLink1URL: http://www.keyelco.com/userAssets/file/M60-2p60.pdf; Publisher: Texas Instruments; LatestRevisionDate: 26/05/2017; Supplier 1: Digi-Key; Supplier Part Number 1: 36-5001-ND; Supplier 2: Mouser; Supplier Part Number 2: 534-5001; Color: Black; Green_EU RoHS-2: Incomplete; Green_EU RoHS: Passed
U26 = CMP-0043115-2: ESD-Protection Array for High-Speed Data Interfaces, 4 Channels, -40 to +85 degC, 6-pin SON (DRY), Green (RoHS & no Sb/Br); Manufacturer: Texas Instruments; 1394 / Firewire: TRUE; Breakdown Voltage(Min)(V): 6; IEC 61000-4-2 Air-Gap(+/- kV): 12; IEC 61000-4-2 Contact(+/- kV): 8; IO Capacitance(Typ)(pF): 1.6; IO Leakage Current(nA): 1; SubFamily: ESD Solution; AEC Category: Q200; AEC Qualified: N; CompType: IC; SizeArea_mm2: 1.45; SizeAreaWB_mm2: 4.9; SizeX_mm: 1.0; SizeZ_mm: 0.6; DatasheetVersion: SLVS729A; PackageVersion: revF, Dec-2011; PackageReference: DRY0006A; PackageDescription: USON-6; Eco-Plan: Green (RoHS & no Sb/Br); Serial ATA / eSATA: TRUE; USB High Speed: TRUE; MountType: SMT; ComponentLink1Description: Datasheet Link; ComponentLink1URL: http://www.ti.com/lit/ds/symlink/tpd4e004.pdf; ComponentLink2Description: Product Folder; ComponentLink2URL: http://www.ti.com/product/tpd4e004; ComponentLink3Description: Online Datasheet; ComponentLink3URL: http://www.ti.com/product/tpd4e004/datasheet; Mounting Technology: Surface Mount; RoHS: Y; SizeY_mm: 1.45
U27 = CMP-0067353-1: Voltage Monitor with Manual Reset, DBV0005A (SOT-23-5); Alternate PartNumber: TPS3825-33DBVT; Manufacturer: Texas Instruments; CompType: IC; U/M: EA; SizeArea_mm2: 8.12; SizeAreaWB_mm2: 14.82; SizeX_mm: 2.8; SizeY_mm: 2.9; SizeZ_mm: 1.45; Green_Lifecycle: Active; Green_REACh: Passed; PackageReference: DBV0005A; MountType: SMT; ComponentLink1Description: Datasheet Link; ComponentLink1URL: http://www.ti.com/lit/ds/symlink/tps3820-50.pdf; RoHS: Y; Publisher: Texas Instruments; LatestRevisionDate: 2017-06-09; Alternate Manufacturer: Texas Instruments; PackageDescription: SOT-23-5; Footprint Path 6: C:\AltiumLibraries\Footprints\TI\.PcbLib; Green_EU RoHS-2: Passed; Green_EU RoHS: Passed
U28 = CMP-0038965-1: 25 MHz Mixed Signal Microcontroller with 128 KB Flash, 8192 B SRAM and 63 GPIOs, -40 to 85 degC, 80-pin QFP (PN), Green (RoHS & no Sb/Br); Manufacturer: Texas Instruments; ADC: 12-bit SAR; ADC Channels: 16; Brown Out Reset: Yes; DMA: 3; Flash(KB): 128; Frequency(MHz): 25; GPIO: 63; Multiplier: 32x32; SRAM(B): 8192; SubFamily: 5 Series; Timers - 16-bit: 4; USB: 1; USCI_A (UART/LIN/IrDA/SPI): 2; DatasheetVersion: SLAS590I; PackageReference: PN0080A; PackageDescription: 80-Pin Plastic Quad Flat Pack, Body 12 x 12 mm, Pitch 0.5 mm; Comparators: Yes; Eco-Plan: Green (RoHS & no Sb/Br); Real-Time Clock: Yes; SVS: Yes; Temp Sensor: Yes; USCI_B (I2C & SPI): 2; Watchdog: Yes; Code_JEDEC: MS-018; ComponentLink1Description: Manufacturer URL; ComponentLink1URL: http://www.ti.com/; ComponentLink2Description: Datasheet; ComponentLink2URL: http://www.ti.com/general/docs/lit/getliterature.tsp?genericPartNumber=MSP430F5529&fileType=pdf; ComponentLink3Description: Package Specification; ComponentLink3URL: http://www.ti.com/lit/ml/mtqf010a/mtqf010a.pdf; Mounting Technology: Surface Mount
Y1 = CMP-0004628-3: CRYSTAL, 32.768KHz, 12.5PF, SMD; PartNumber: ABS07-32.768KHZ-T; Manufacturer: Abracon Corporation; TaMin_C: -40°C; TaMax_C: 85°C; Frequency Stability: +/-20ppm; CompType: Crystal; PackageReference: 3.2x0.9x1.5mm; MountType: SMT; RoHS: Y; ComponentLink1Description: Datasheet Link; ComponentLink1URL: http://www.abracon.com/Resonators/ABS07.pdf; Supplier 1: Digi-Key; Supplier Part Number 1: 535-9542-1-ND; Supplier 2: Newark; Supplier Part Number 2: 14N8749; Supplier 3: Mouser; Supplier Part Number 3: 815-ABS07-32.768KHZT; Frequency_Fixed: 32.768kHz; REACh: Y
Y2 = CMP-0004629-4: Crystal, 24 MHz, 10 pF, SMD; PartNumber: ABM3B-24.000MHZ-10-1-U-T; Manufacturer: Abracon Corporation; TaMin_C: -10°C; TaMax_C: 60°C; Frequency Stability: 10 ppm; SizeAreaWB_mm2: 36.4; SizeArea_mm2: 16; SizeX_mm: 3.2; SizeY_mm: 5; SizeZ_mm: 1.1; AEC Category: Q200; AEC Qualified: N; Frequency_Fixed: 24MHz; CompType: Crystal; PackageReference: Crystal, 3.2x1.1x5.x mm; MountType: SMT; RoHS: Y; ComponentLink1Description: Datasheet Link; ComponentLink1URL: http://www.abracon.com/Resonators/abm3b.pdf; Supplier 1: Digi-Key; Supplier Part Number 1: 300-8216-1-ND; Supplier 2: Newark; Supplier Part Number 2: 40Y2007; Supplier 3: Mouser; Supplier Part Number 3: 815-ABM3B-24-T; AEC Grade: N/A; REACh: Y